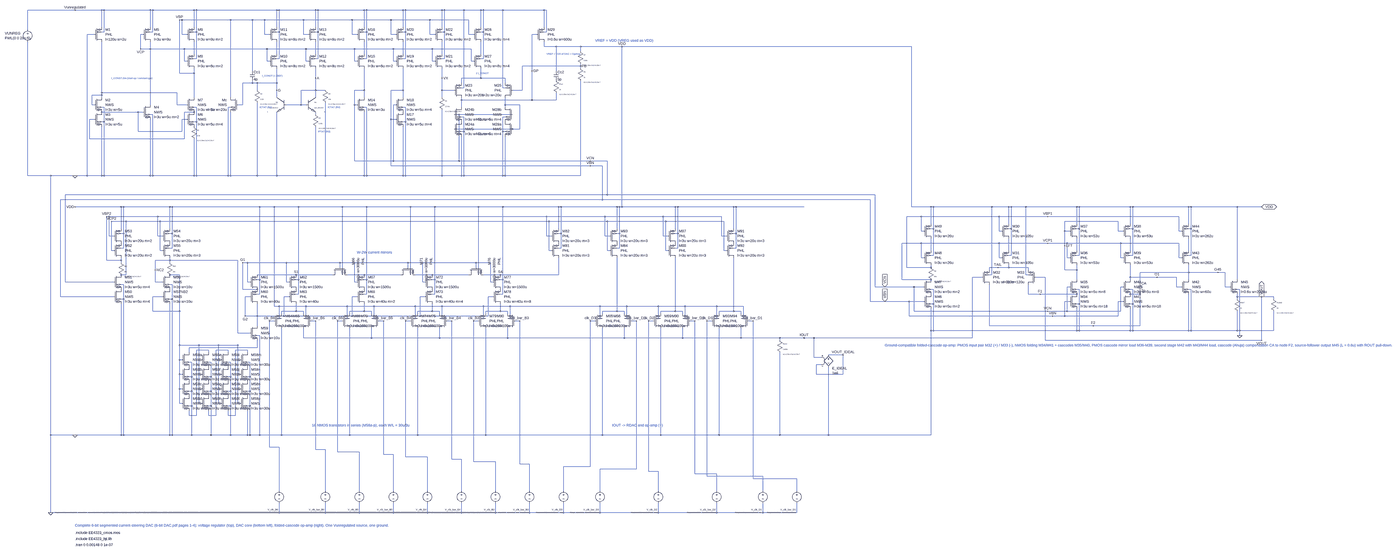
[diagram p0: schematic 04_Complete_6Bit_DAC.asc, whole sheet]
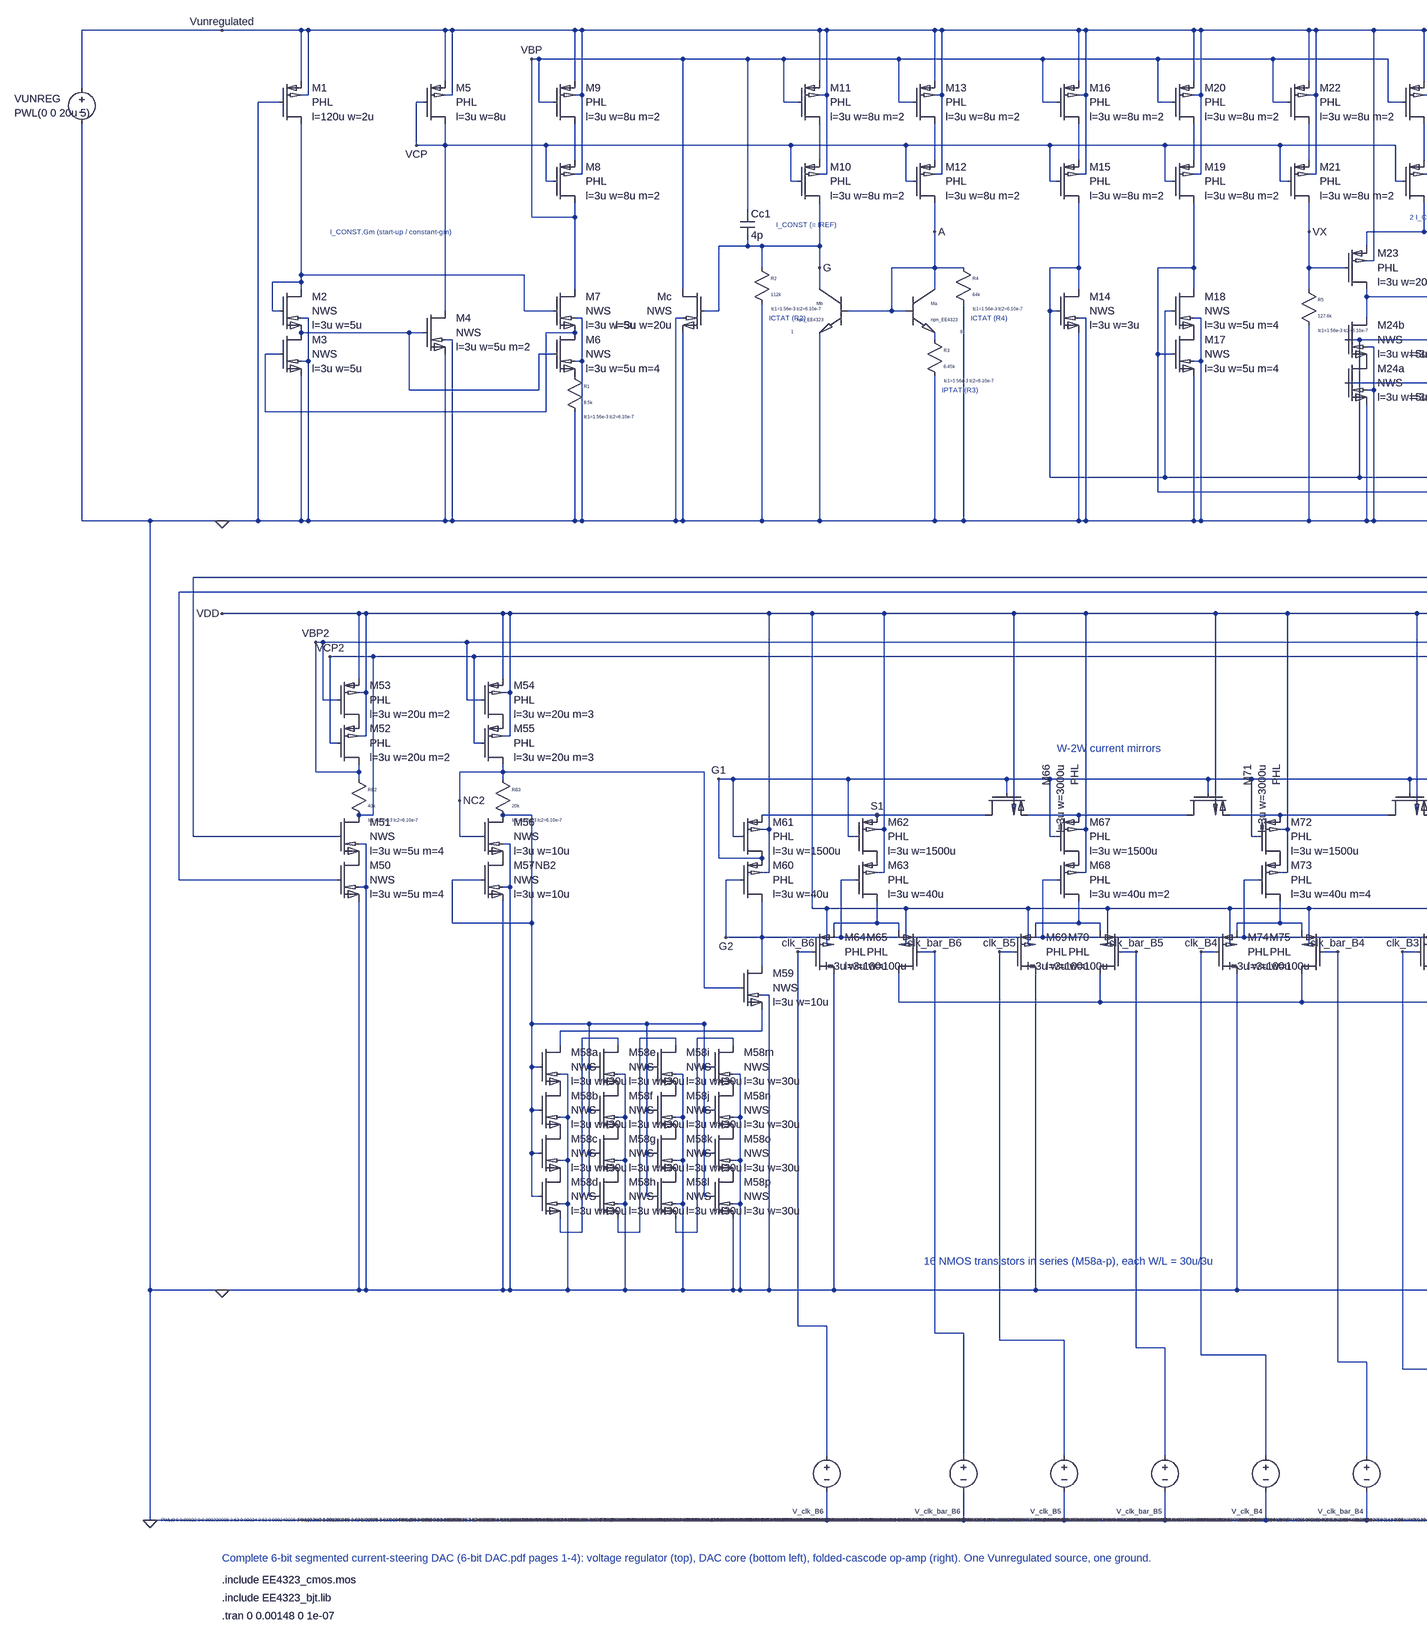
[diagram p1: schematic 04_Complete_6Bit_DAC.asc, part, row 1 of 1, column 1 of 3]
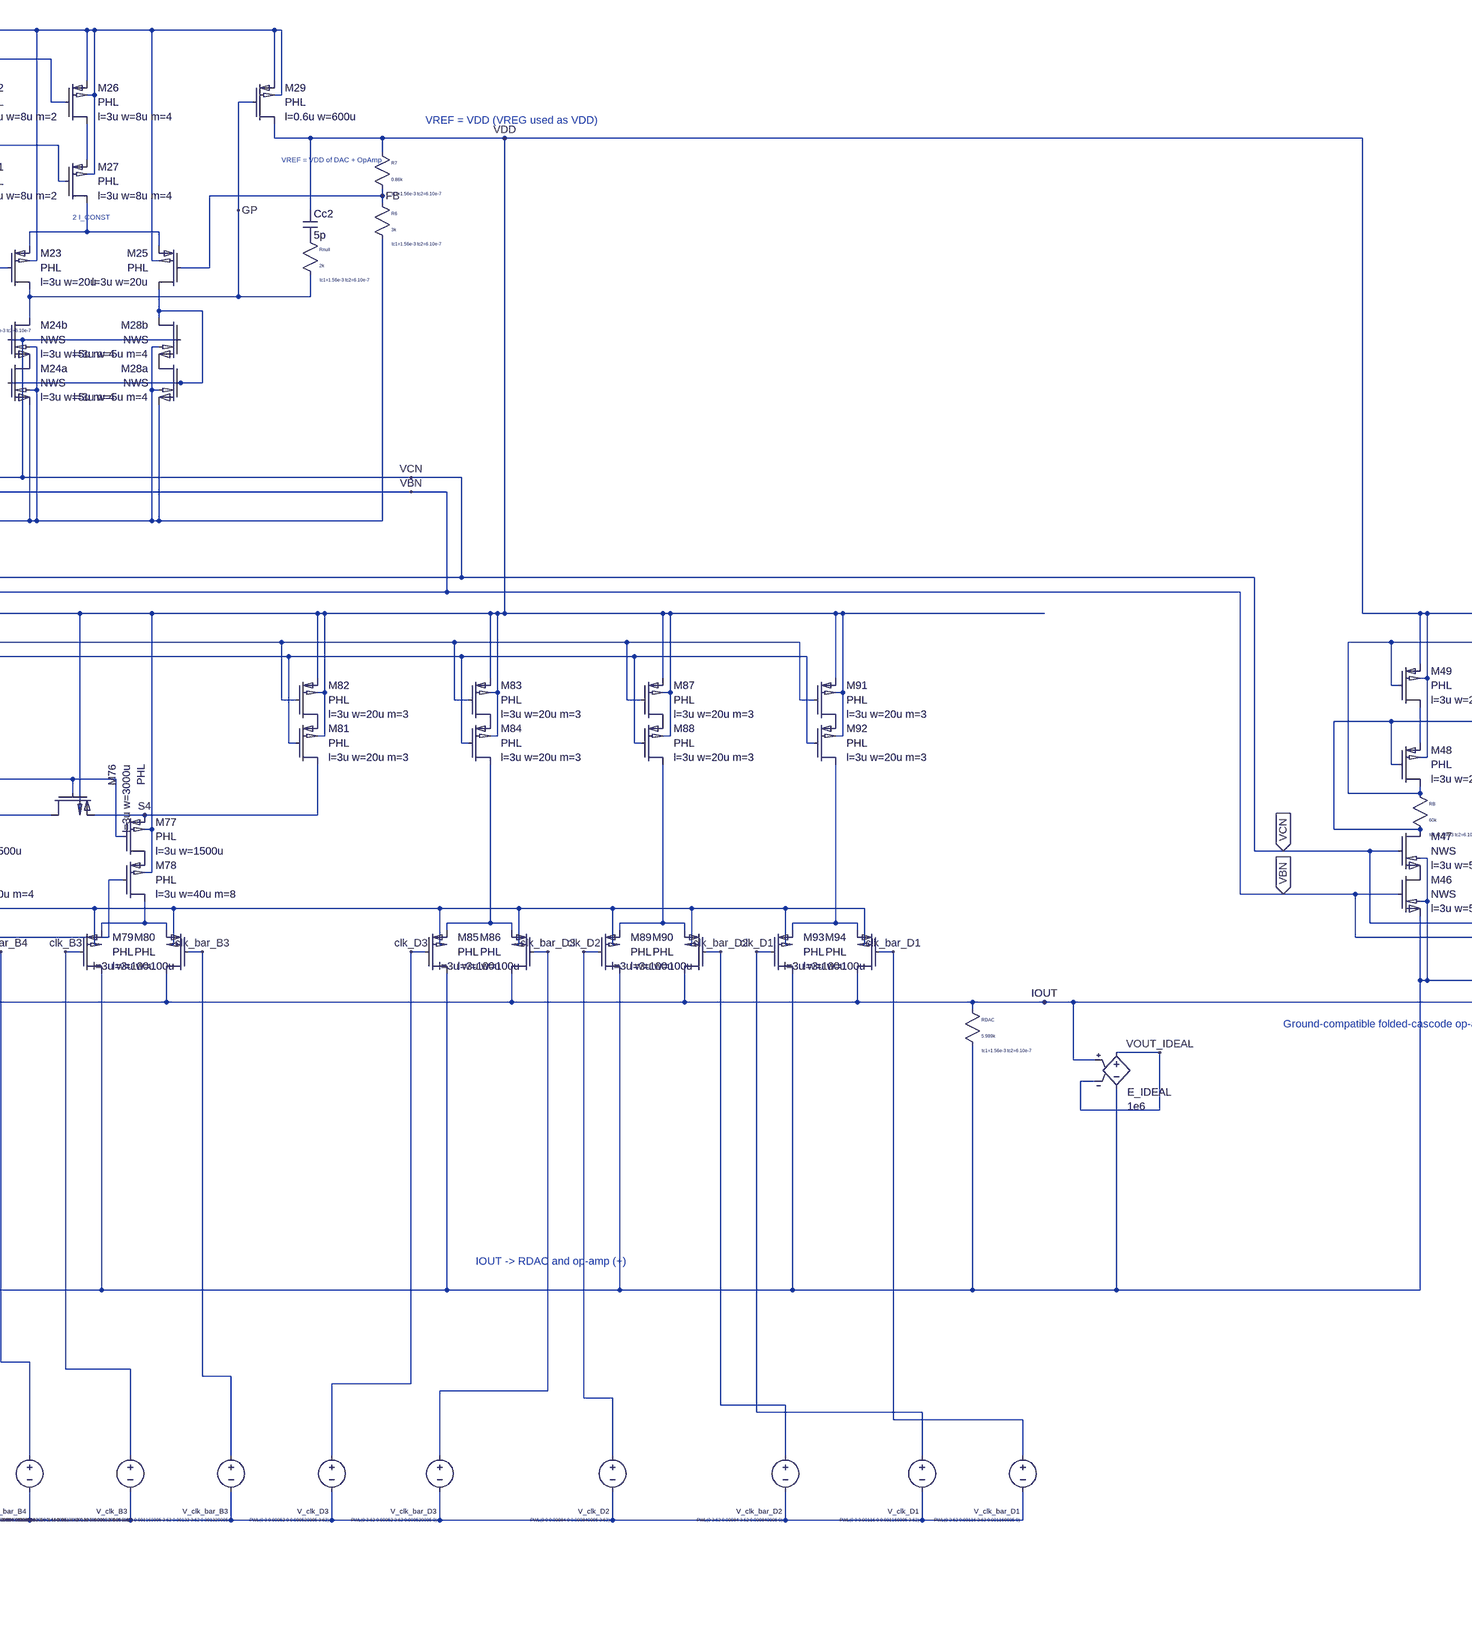
[diagram p2: schematic 04_Complete_6Bit_DAC.asc, part, row 1 of 1, column 2 of 3]
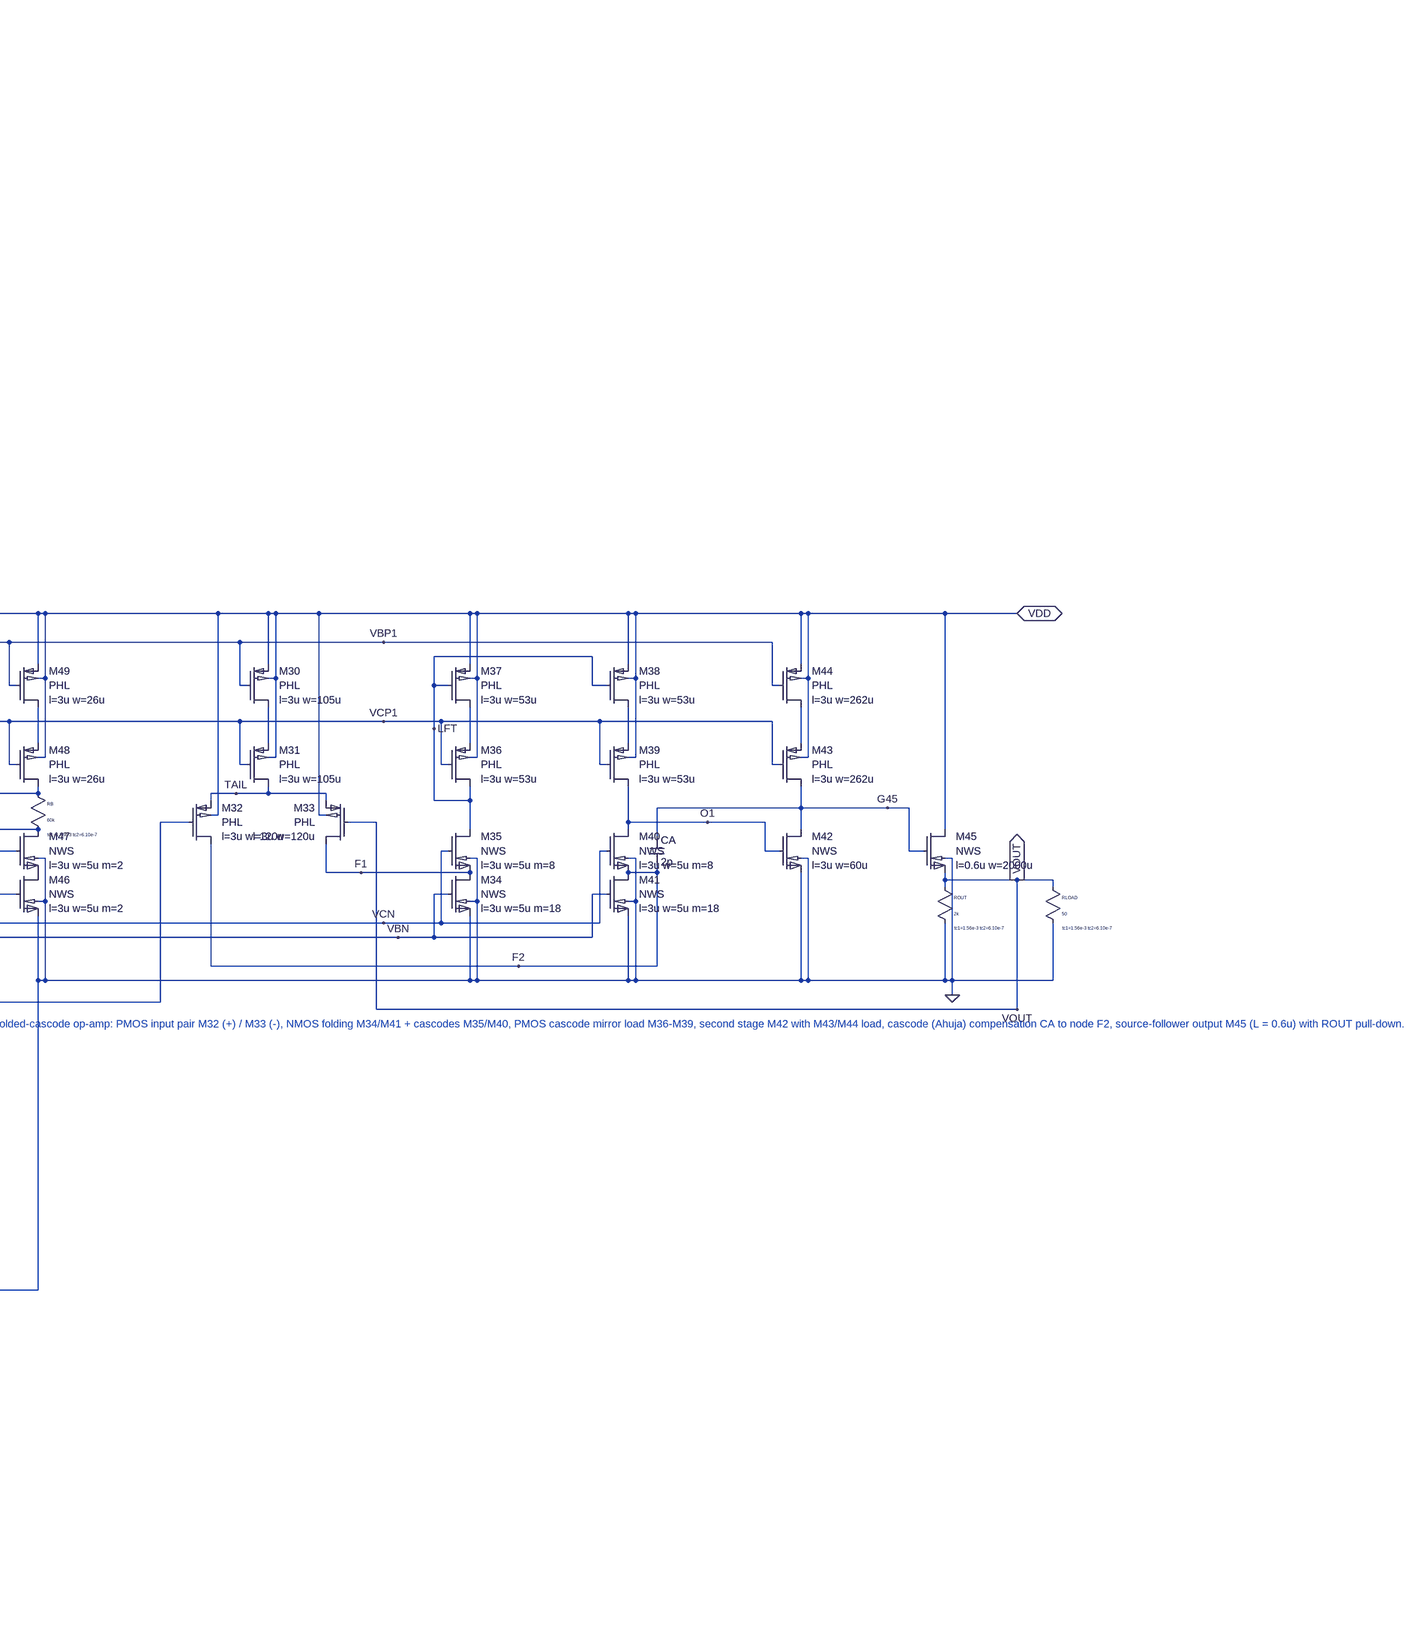
[diagram p3: schematic 04_Complete_6Bit_DAC.asc, part, row 1 of 1, column 3 of 3]
* 04_Complete_6Bit_DAC.asc
M1 N001 0 Vunregulated Vunregulated PHL l=120u w=2u
M2 N001 N001 N002 0 NWS l=3u w=5u
M3 N002 N004 0 0 NWS l=3u w=5u
M4 VCP N002 0 0 NWS l=3u w=5u m=2
M5 VCP VCP Vunregulated Vunregulated PHL l=3u w=8u
M9 N003 VBP Vunregulated Vunregulated PHL l=3u w=8u m=2
M8 VBP VCP N003 Vunregulated PHL l=3u w=8u m=2
M7 VBP N001 N004 0 NWS l=3u w=5u
M6 N004 N002 P001 0 NWS l=3u w=5u m=4
R1 P001 0 8.5k tc1=1.56e-3 tc2=6.10e-7
Mc VBP G 0 0 NWS l=3u w=20u
Cc1 VBP G 4p
R2 G 0 112k tc1=1.56e-3 tc2=6.10e-7
M11 N005 VBP Vunregulated Vunregulated PHL l=3u w=8u m=2
M10 G VCP N005 Vunregulated PHL l=3u w=8u m=2
Q§Mb G A 0 0 npn_EE4323 1
M13 N006 VBP Vunregulated Vunregulated PHL l=3u w=8u m=2
M12 A VCP N006 Vunregulated PHL l=3u w=8u m=2
Q§Ma A A N007 0 npn_EE4323 8
R3 N007 0 6.45k tc1=1.56e-3 tc2=6.10e-7
R4 A 0 64k tc1=1.56e-3 tc2=6.10e-7
M16 N008 VBP Vunregulated Vunregulated PHL l=3u w=8u m=2
M15 VCN VCP N008 Vunregulated PHL l=3u w=8u m=2
M14 VCN VCN 0 0 NWS l=3u w=3u
M20 N009 VBP Vunregulated Vunregulated PHL l=3u w=8u m=2
M19 VBN VCP N009 Vunregulated PHL l=3u w=8u m=2
M18 VBN VCN P002 0 NWS l=3u w=5u m=4
M17 P002 VBN 0 0 NWS l=3u w=5u m=4
M22 N010 VBP Vunregulated Vunregulated PHL l=3u w=8u m=2
M21 VX VCP N010 Vunregulated PHL l=3u w=8u m=2
R5 VX 0 127.6k tc1=1.56e-3 tc2=6.10e-7
M26 N011 VBP Vunregulated Vunregulated PHL l=3u w=8u m=4
M27 N012 VCP N011 Vunregulated PHL l=3u w=8u m=4
M23 GP VX N012 Vunregulated PHL l=3u w=20u
M25 N013 FB N012 Vunregulated PHL l=3u w=20u
M24b GP VCN P003 0 NWS l=3u w=5u m=4
M24a P003 N013 0 0 NWS l=3u w=5u m=4
M28b N013 VCN P004 0 NWS l=3u w=5u m=4
M28a P004 N013 0 0 NWS l=3u w=5u m=4
M29 VDD GP Vunregulated Vunregulated PHL l=0.6u w=600u
R7 VDD FB 0.86k tc1=1.56e-3 tc2=6.10e-7
R6 FB 0 3k tc1=1.56e-3 tc2=6.10e-7
Cc2 VDD P005 5p
Rnull P005 GP 2k tc1=1.56e-3 tc2=6.10e-7
M53 P006 VBP2 VDD VDD PHL l=3u w=20u m=2
M52 VBP2 VCP2 P006 VDD PHL l=3u w=20u m=2
RB2 VBP2 VCP2 40k tc1=1.56e-3 tc2=6.10e-7
M51 VCP2 VCN P007 0 NWS l=3u w=5u m=4
M50 P007 VBN 0 0 NWS l=3u w=5u m=4
M54 P008 VBP2 VDD VDD PHL l=3u w=20u m=3
M55 NC2 VCP2 P008 VDD PHL l=3u w=20u m=3
RB3 NC2 NB2 20k tc1=1.56e-3 tc2=6.10e-7
M56 NB2 NC2 P009 0 NWS l=3u w=10u
M57 P009 NB2 0 0 NWS l=3u w=10u
M61 G1 G1 S1 VDD PHL l=3u w=1500u
M60 G2 G2 G1 VDD PHL l=3u w=40u
M59 G2 NC2 N014 0 NWS l=3u w=10u
M58a N014 NB2 P010 0 NWS l=3u w=30u
M58b P010 NB2 P011 0 NWS l=3u w=30u
M58c P011 NB2 P012 0 NWS l=3u w=30u
M58d P012 NB2 N015 0 NWS l=3u w=30u
M58e N015 NB2 P013 0 NWS l=3u w=30u
M58f P013 NB2 P014 0 NWS l=3u w=30u
M58g P014 NB2 P015 0 NWS l=3u w=30u
M58h P015 NB2 N016 0 NWS l=3u w=30u
M58i N016 NB2 P016 0 NWS l=3u w=30u
M58j P016 NB2 P017 0 NWS l=3u w=30u
M58k P017 NB2 P018 0 NWS l=3u w=30u
M58l P018 NB2 N017 0 NWS l=3u w=30u
M58m N017 NB2 P019 0 NWS l=3u w=30u
M58n P019 NB2 P020 0 NWS l=3u w=30u
M58o P020 NB2 P021 0 NWS l=3u w=30u
M58p P021 NB2 0 0 NWS l=3u w=30u
M62 P022 G1 S1 VDD PHL l=3u w=1500u
M63 N018 G2 P022 VDD PHL l=3u w=40u
M64 0 clk_B6 N018 VDD PHL l=3u w=100u
M65 IOUT clk_bar_B6 N018 VDD PHL l=3u w=100u
M67 P023 G1 N022 VDD PHL l=3u w=1500u
M68 N019 G2 P023 VDD PHL l=3u w=40u m=2
M69 0 clk_B5 N019 VDD PHL l=3u w=100u
M70 IOUT clk_bar_B5 N019 VDD PHL l=3u w=100u
M72 P024 G1 N023 VDD PHL l=3u w=1500u
M73 N020 G2 P024 VDD PHL l=3u w=40u m=4
M74 0 clk_B4 N020 VDD PHL l=3u w=100u
M75 IOUT clk_bar_B4 N020 VDD PHL l=3u w=100u
M77 P025 G1 S4 VDD PHL l=3u w=1500u
M78 N021 G2 P025 VDD PHL l=3u w=40u m=8
M79 0 clk_B3 N021 VDD PHL l=3u w=100u
M80 IOUT clk_bar_B3 N021 VDD PHL l=3u w=100u
M66 S1 G1 N022 VDD PHL l=3u w=3000u
M71 N022 G1 N023 VDD PHL l=3u w=3000u
M76 N023 G1 S4 VDD PHL l=3u w=3000u
M82 P026 VBP2 VDD VDD PHL l=3u w=20u m=3
M81 S4 VCP2 P026 VDD PHL l=3u w=20u m=3
M83 P027 VBP2 VDD VDD PHL l=3u w=20u m=3
M84 N024 VCP2 P027 VDD PHL l=3u w=20u m=3
M85 0 clk_D3 N024 VDD PHL l=3u w=100u
M86 IOUT clk_bar_D3 N024 VDD PHL l=3u w=100u
M87 P028 VBP2 VDD VDD PHL l=3u w=20u m=3
M88 N025 VCP2 P028 VDD PHL l=3u w=20u m=3
M89 0 clk_D2 N025 VDD PHL l=3u w=100u
M90 IOUT clk_bar_D2 N025 VDD PHL l=3u w=100u
M91 P029 VBP2 VDD VDD PHL l=3u w=20u m=3
M92 N026 VCP2 P029 VDD PHL l=3u w=20u m=3
M93 0 clk_D1 N026 VDD PHL l=3u w=100u
M94 IOUT clk_bar_D1 N026 VDD PHL l=3u w=100u
RDAC IOUT 0 5.989k tc1=1.56e-3 tc2=6.10e-7
M49 N027 VBP1 VDD VDD PHL l=3u w=26u
M48 VBP1 VCP1 N027 VDD PHL l=3u w=26u
RB VBP1 VCP1 60k tc1=1.56e-3 tc2=6.10e-7
M47 VCP1 VCN P030 0 NWS l=3u w=5u m=2
M46 P030 VBN 0 0 NWS l=3u w=5u m=2
M30 N028 VBP1 VDD VDD PHL l=3u w=105u
M31 TAIL VCP1 N028 VDD PHL l=3u w=105u
M32 F2 IOUT TAIL VDD PHL l=3u w=120u
M33 F1 VOUT TAIL VDD PHL l=3u w=120u
M37 N029 LFT VDD VDD PHL l=3u w=53u
M36 LFT VCP1 N029 VDD PHL l=3u w=53u
M38 N030 LFT VDD VDD PHL l=3u w=53u
M39 O1 VCP1 N030 VDD PHL l=3u w=53u
M35 LFT VCN F1 0 NWS l=3u w=5u m=8
M34 F1 VBN 0 0 NWS l=3u w=5u m=18
M40 O1 VCN F2 0 NWS l=3u w=5u m=8
M41 F2 VBN 0 0 NWS l=3u w=5u m=18
M44 N031 VBP1 VDD VDD PHL l=3u w=262u
M43 G45 VCP1 N031 VDD PHL l=3u w=262u
M42 G45 O1 0 0 NWS l=3u w=60u
CA G45 F2 2p
M45 VDD G45 VOUT 0 NWS l=0.6u w=2000u
ROUT VOUT 0 2k tc1=1.56e-3 tc2=6.10e-7
VUNREG Vunregulated 0 PWL(0 0 20u 5)
RLOAD VOUT 0 50 tc1=1.56e-3 tc2=6.10e-7
E_IDEAL VOUT_IDEAL 0 IOUT VOUT_IDEAL 1e6
V_clk_B6 clk_B6 0 PWL(0 0 0.00022 0 0.000220005 3.62 0.00024 3.62 0.000240005 0 0.00026 0 0.000260005 3.62 0.00028 3.62 0.000280005 0 0.0003 0 0.000300005 3.62 0.00032 3.62 0.000320005 0 0.00034 0 0.000340005 3.62 0.00036 3.62 0.000360005 0 0.00038 0 0.000380005 3.62 0.0004 3.62 0.000400005 0 0.00042 0 0.000420005 3.62 0.00044 3.62 0.000440005 0 0.00046 0 0.000460005 3.62 0.00048 3.62 0.000480005 0 0.0005 0 0.000500005 3.62 0.00052 3.62 0.000520005 0 0.00054 0 0.000540005 3.62 0.00056 3.62 0.000560005 0 0.00058 0 0.000580005 3.62 0.0006 3.62 0.000600005 0 0.00062 0 0.000620005 3.62 0.00064 3.62 0.000640005 0 0.00066 0 0.000660005 3.62 0.00068 3.62 0.000680005 0 0.0007 0 0.000700005 3.62 0.00072 3.62 0.000720005 0 0.00074 0 0.000740005 3.62 0.00076 3.62 0.000760005 0 0.00078 0 0.000780005 3.62 0.0008 3.62 0.000800005 0 0.00082 0 0.000820005 3.62 0.00084 3.62 0.000840005 0 0.00086 0 0.000860005 3.62 0.00088 3.62 0.000880005 0 0.0009 0 0.000900005 3.62 0.00092 3.62 0.000920005 0 0.00094 0 0.000940005 3.62 0.00096 3.62 0.000960005 0 0.00098 0 0.000980005 3.62 0.001 3.62 0.001000005 0 0.00102 0 0.001020005 3.62 0.00104 3.62 0.001040005 0 0.00106 0 0.001060005 3.62 0.00108 3.62 0.001080005 0 0.0011 0 0.001100005 3.62 0.00112 3.62 0.001120005 0 0.00114 0 0.001140005 3.62 0.00116 3.62 0.001160005 0 0.00118 0 0.001180005 3.62 0.0012 3.62 0.001200005 0 0.00122 0 0.001220005 3.62 0.00124 3.62 0.001240005 0 0.00126 0 0.001260005 3.62 0.00128 3.62 0.001280005 0 0.0013 0 0.001300005 3.62 0.00132 3.62 0.001320005 0 0.00134 0 0.001340005 3.62 0.00136 3.62 0.001360005 0 0.00138 0 0.001380005 3.62 0.0014 3.62 0.001400005 0 0.00142 0 0.001420005 3.62 0.00144 3.62 0.001440005 0 0.00146 0 0.001460005 3.62)
V_clk_bar_B6 clk_bar_B6 0 PWL(0 3.62 0.00022 3.62 0.000220005 0 0.00024 0 0.000240005 3.62 0.00026 3.62 0.000260005 0 0.00028 0 0.000280005 3.62 0.0003 3.62 0.000300005 0 0.00032 0 0.000320005 3.62 0.00034 3.62 0.000340005 0 0.00036 0 0.000360005 3.62 0.00038 3.62 0.000380005 0 0.0004 0 0.000400005 3.62 0.00042 3.62 0.000420005 0 0.00044 0 0.000440005 3.62 0.00046 3.62 0.000460005 0 0.00048 0 0.000480005 3.62 0.0005 3.62 0.000500005 0 0.00052 0 0.000520005 3.62 0.00054 3.62 0.000540005 0 0.00056 0 0.000560005 3.62 0.00058 3.62 0.000580005 0 0.0006 0 0.000600005 3.62 0.00062 3.62 0.000620005 0 0.00064 0 0.000640005 3.62 0.00066 3.62 0.000660005 0 0.00068 0 0.000680005 3.62 0.0007 3.62 0.000700005 0 0.00072 0 0.000720005 3.62 0.00074 3.62 0.000740005 0 0.00076 0 0.000760005 3.62 0.00078 3.62 0.000780005 0 0.0008 0 0.000800005 3.62 0.00082 3.62 0.000820005 0 0.00084 0 0.000840005 3.62 0.00086 3.62 0.000860005 0 0.00088 0 0.000880005 3.62 0.0009 3.62 0.000900005 0 0.00092 0 0.000920005 3.62 0.00094 3.62 0.000940005 0 0.00096 0 0.000960005 3.62 0.00098 3.62 0.000980005 0 0.001 0 0.001000005 3.62 0.00102 3.62 0.001020005 0 0.00104 0 0.001040005 3.62 0.00106 3.62 0.001060005 0 0.00108 0 0.001080005 3.62 0.0011 3.62 0.001100005 0 0.00112 0 0.001120005 3.62 0.00114 3.62 0.001140005 0 0.00116 0 0.001160005 3.62 0.00118 3.62 0.001180005 0 0.0012 0 0.001200005 3.62 0.00122 3.62 0.001220005 0 0.00124 0 0.001240005 3.62 0.00126 3.62 0.001260005 0 0.00128 0 0.001280005 3.62 0.0013 3.62 0.001300005 0 0.00132 0 0.001320005 3.62 0.00134 3.62 0.001340005 0 0.00136 0 0.001360005 3.62 0.00138 3.62 0.001380005 0 0.0014 0 0.001400005 3.62 0.00142 3.62 0.001420005 0 0.00144 0 0.001440005 3.62 0.00146 3.62 0.001460005 0)
V_clk_B5 clk_B5 0 PWL(0 0 0.00024 0 0.000240005 3.62 0.00028 3.62 0.000280005 0 0.00032 0 0.000320005 3.62 0.00036 3.62 0.000360005 0 0.0004 0 0.000400005 3.62 0.00044 3.62 0.000440005 0 0.00048 0 0.000480005 3.62 0.00052 3.62 0.000520005 0 0.00056 0 0.000560005 3.62 0.0006 3.62 0.000600005 0 0.00064 0 0.000640005 3.62 0.00068 3.62 0.000680005 0 0.00072 0 0.000720005 3.62 0.00076 3.62 0.000760005 0 0.0008 0 0.000800005 3.62 0.00084 3.62 0.000840005 0 0.00088 0 0.000880005 3.62 0.00092 3.62 0.000920005 0 0.00096 0 0.000960005 3.62 0.001 3.62 0.001000005 0 0.00104 0 0.001040005 3.62 0.00108 3.62 0.001080005 0 0.00112 0 0.001120005 3.62 0.00116 3.62 0.001160005 0 0.0012 0 0.001200005 3.62 0.00124 3.62 0.001240005 0 0.00128 0 0.001280005 3.62 0.00132 3.62 0.001320005 0 0.00136 0 0.001360005 3.62 0.0014 3.62 0.001400005 0 0.00144 0 0.001440005 3.62)
V_clk_bar_B5 clk_bar_B5 0 PWL(0 3.62 0.00024 3.62 0.000240005 0 0.00028 0 0.000280005 3.62 0.00032 3.62 0.000320005 0 0.00036 0 0.000360005 3.62 0.0004 3.62 0.000400005 0 0.00044 0 0.000440005 3.62 0.00048 3.62 0.000480005 0 0.00052 0 0.000520005 3.62 0.00056 3.62 0.000560005 0 0.0006 0 0.000600005 3.62 0.00064 3.62 0.000640005 0 0.00068 0 0.000680005 3.62 0.00072 3.62 0.000720005 0 0.00076 0 0.000760005 3.62 0.0008 3.62 0.000800005 0 0.00084 0 0.000840005 3.62 0.00088 3.62 0.000880005 0 0.00092 0 0.000920005 3.62 0.00096 3.62 0.000960005 0 0.001 0 0.001000005 3.62 0.00104 3.62 0.001040005 0 0.00108 0 0.001080005 3.62 0.00112 3.62 0.001120005 0 0.00116 0 0.001160005 3.62 0.0012 3.62 0.001200005 0 0.00124 0 0.001240005 3.62 0.00128 3.62 0.001280005 0 0.00132 0 0.001320005 3.62 0.00136 3.62 0.001360005 0 0.0014 0 0.001400005 3.62 0.00144 3.62 0.001440005 0)
V_clk_B4 clk_B4 0 PWL(0 0 0.00028 0 0.000280005 3.62 0.00036 3.62 0.000360005 0 0.00044 0 0.000440005 3.62 0.00052 3.62 0.000520005 0 0.0006 0 0.000600005 3.62 0.00068 3.62 0.000680005 0 0.00076 0 0.000760005 3.62 0.00084 3.62 0.000840005 0 0.00092 0 0.000920005 3.62 0.001 3.62 0.001000005 0 0.00108 0 0.001080005 3.62 0.00116 3.62 0.001160005 0 0.00124 0 0.001240005 3.62 0.00132 3.62 0.001320005 0 0.0014 0 0.001400005 3.62)
V_clk_bar_B4 clk_bar_B4 0 PWL(0 3.62 0.00028 3.62 0.000280005 0 0.00036 0 0.000360005 3.62 0.00044 3.62 0.000440005 0 0.00052 0 0.000520005 3.62 0.0006 3.62 0.000600005 0 0.00068 0 0.000680005 3.62 0.00076 3.62 0.000760005 0 0.00084 0 0.000840005 3.62 0.00092 3.62 0.000920005 0 0.001 0 0.001000005 3.62 0.00108 3.62 0.001080005 0 0.00116 0 0.001160005 3.62 0.00124 3.62 0.001240005 0 0.00132 0 0.001320005 3.62 0.0014 3.62 0.001400005 0)
V_clk_B3 clk_B3 0 PWL(0 0 0.00036 0 0.000360005 3.62 0.00052 3.62 0.000520005 0 0.00068 0 0.000680005 3.62 0.00084 3.62 0.000840005 0 0.001 0 0.001000005 3.62 0.00116 3.62 0.001160005 0 0.00132 0 0.001320005 3.62)
V_clk_bar_B3 clk_bar_B3 0 PWL(0 3.62 0.00036 3.62 0.000360005 0 0.00052 0 0.000520005 3.62 0.00068 3.62 0.000680005 0 0.00084 0 0.000840005 3.62 0.001 3.62 0.001000005 0 0.00116 0 0.001160005 3.62 0.00132 3.62 0.001320005 0)
V_clk_D3 clk_D3 0 PWL(0 0 0.00052 0 0.000520005 3.62)
V_clk_bar_D3 clk_bar_D3 0 PWL(0 3.62 0.00052 3.62 0.000520005 0)
V_clk_D2 clk_D2 0 PWL(0 0 0.00084 0 0.000840005 3.62)
V_clk_bar_D2 clk_bar_D2 0 PWL(0 3.62 0.00084 3.62 0.000840005 0)
V_clk_D1 clk_D1 0 PWL(0 0 0.00116 0 0.001160005 3.62)
V_clk_bar_D1 clk_bar_D1 0 PWL(0 3.62 0.00116 3.62 0.001160005 0)
.model NPN NPN
.model PNP PNP
.lib standard.bjt
.model NMOS NMOS
.model PMOS PMOS
.lib standard.mos
* I_CONST,Gm (start-up / constant-gm)
* I_CONST (= IREF)
* IPTAT (R3)
* ICTAT (R4)
* ICTAT (R2)
* 2 I_CONST
* VREF = VDD of DAC + OpAmp
* 16 NMOS transistors in series (M58a-p), each W/L = 30u/3u
* W-2W current mirrors
* IOUT -> RDAC and op-amp (+)
* Ground-compatible folded-cascode op-amp: PMOS input pair M32 (+) / M33 (-), NMOS folding M34/M41 + cascodes M35/M40, PMOS cascode mirror load M36-M39, second stage M42 with M43/M44 load, cascode (Ahuja) compensation CA to node F2, source-follower output M45 (L = 0.6u) with ROUT pull-down.
* VREF = VDD (VREG used as VDD)
* Complete 6-bit segmented current-steering DAC (6-bit DAC.pdf pages 1-4): voltage regulator (top), DAC core (bottom left), folded-cascode op-amp (right). One Vunregulated source, one ground.
.include EE4323_cmos.mos
.include EE4323_bjt.lib
.tran 0 0.00148 0 1e-07
.backanno
.end